# Altium schematic sheet Nguon.SchDoc
size 381 x 241 mm; SheetNumber: 1; SheetTotal: 3
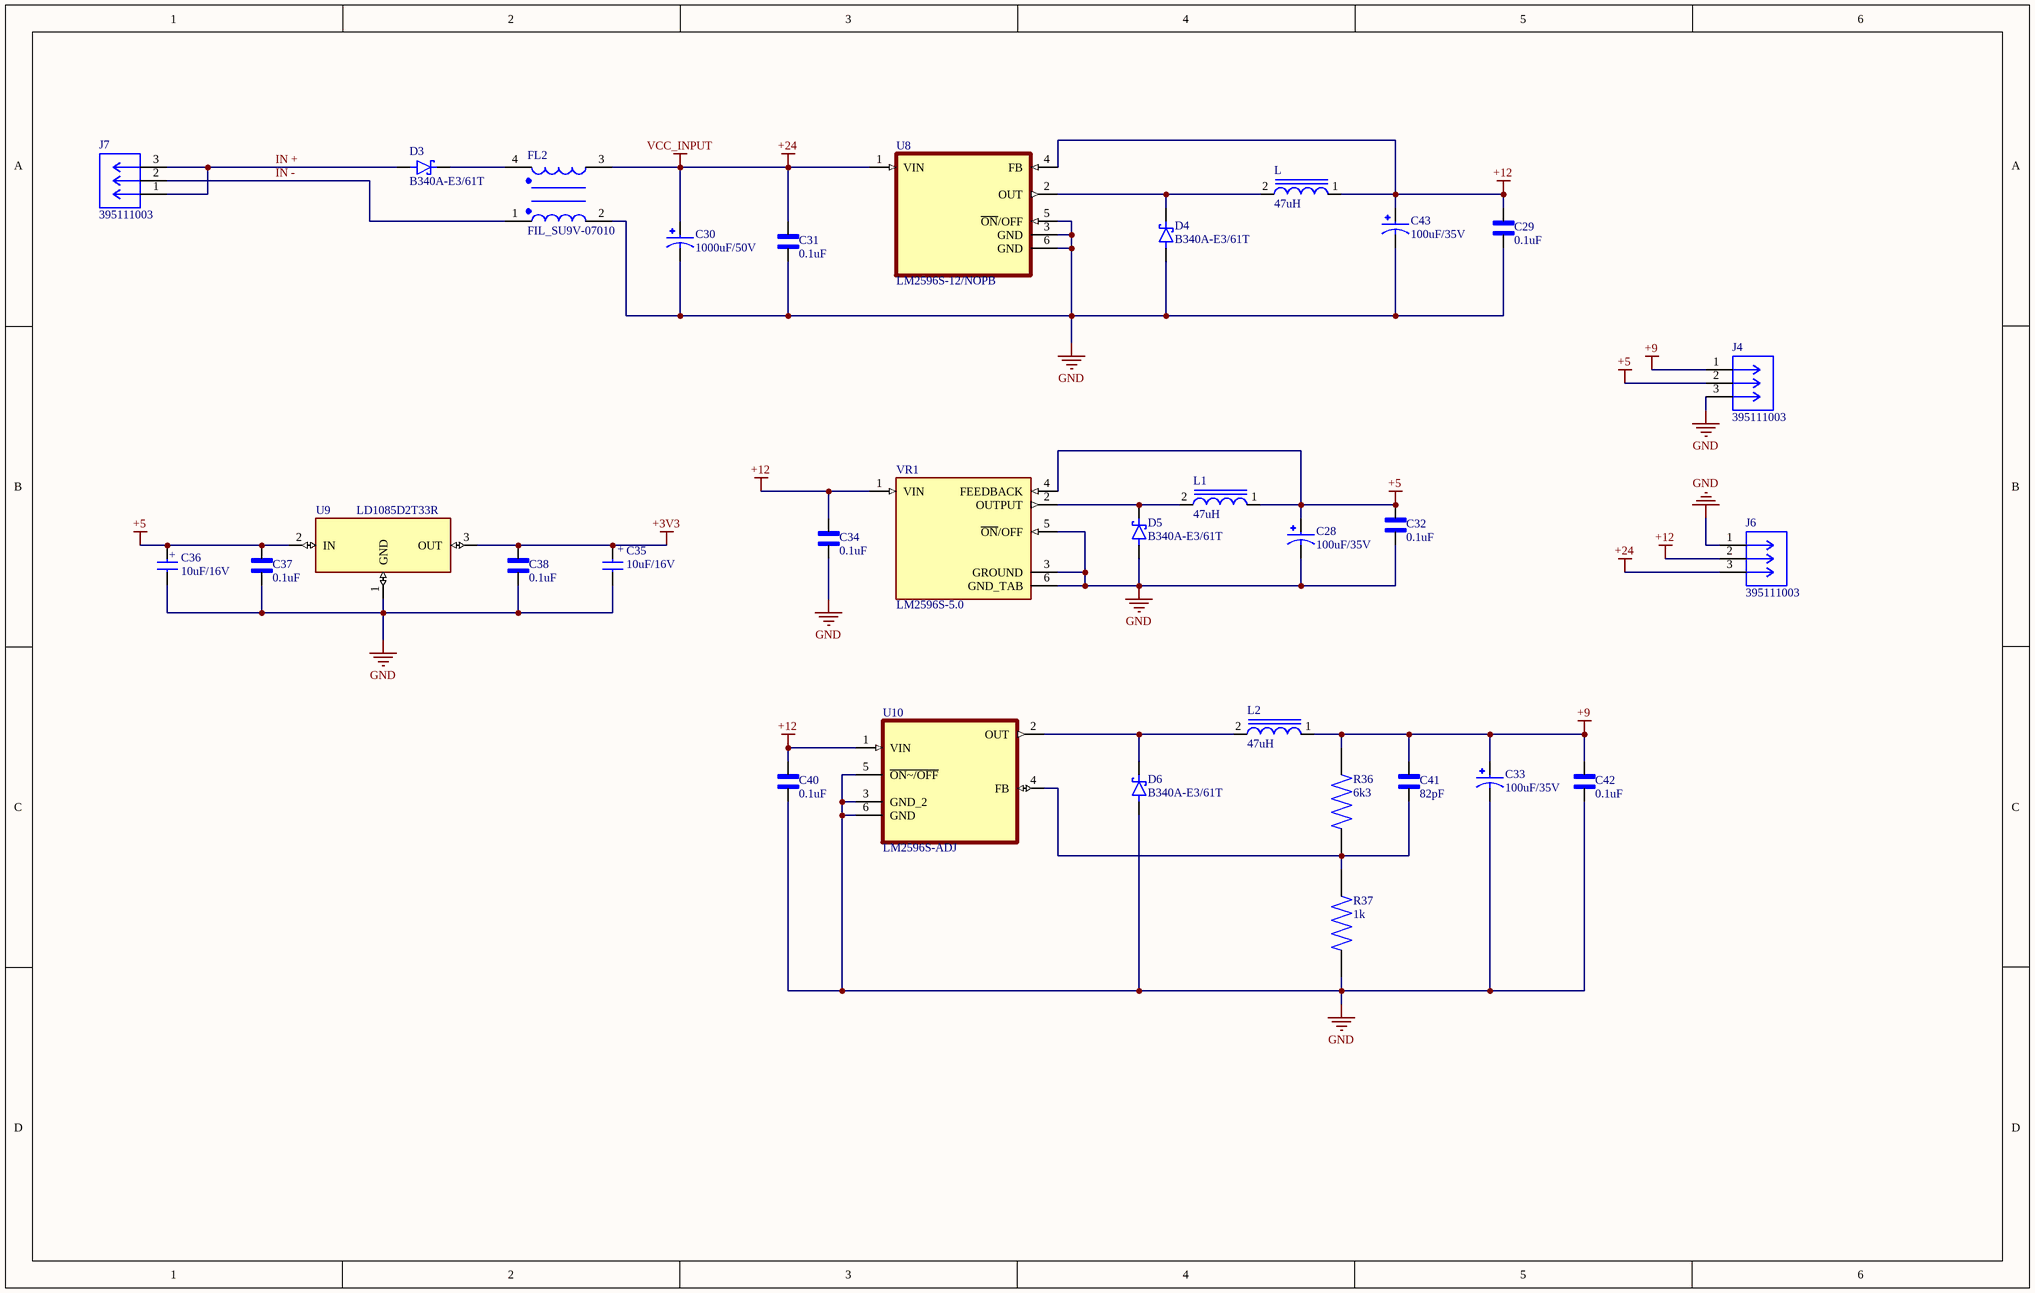
[diagram p0: Nguon.SchDoc]

## Parts
C28  100uF/35V  [CAP_EEEFTE221XAL]
C29  0.1uF  [CAPC1608X94N]
C30  1000uF/50V  [CAP_EEVFK1H102M]
C31  0.1uF  [CAPC1608X94N]
C32  0.1uF  [CAPC1608X94N]
C33  100uF/35V  [CAP_EEEFTE221XAL]
C34  0.1uF  [CAPC1608X94N]
C35  10uF/16V  [WCAP-ASNP_4X5.5(DXL)]
C36  10uF/16V  [WCAP-AS5H_4X5.5(DXL)]
C37  0.1uF  [CAPC1608X94N]
C38  0.1uF  [CAPC1608X94N]
C40  0.1uF  [CAPC1608X94N]
C41  82pF  [CAPC1608X94N]
C42  0.1uF  [CAPC1608X94N]
C43  100uF/35V  [CAP_EEEFTE221XAL]
D3  B340A-E3/61T  [DIOM5126X229N]
D4  B340A-E3/61T  [DIOM5126X229N]
D5  B340A-E3/61T  [DIOM5126X229N]
D6  B340A-E3/61T  [DIOM5126X229N]
FL2  FIL_SU9V-07010  [FIL_SU9V-07010]
J4  395111003  [CONN_SD-39511-001_03P_MOL]
J6  395111003  [CONN_SD-39511-001_03P_MOL]
J7  395111003  [CONN_SD-39511-001_03P_MOL]
L  47uH  [Introdutor_47uH_12x12x7]
L1  47uH  [Introdutor_47uH_12x12x7]
L2  47uH  [Introdutor_47uH_12x12x7]
R36  6k3  [RES_ERJU03J474V]
R37  1k  [RES_ERJU03J474V]
U8  LM2596S-12/NOPB  [VREG_LM2596S-12/NOPB]
U9  LD1085D2T33R  [LD1085D2T33R]
U10  LM2596S-ADJ  [LM2596S-ADJ]
VR1  LM2596S-5.0  [LM2596S-5.0]

## Nets
+3V3: C35.1 C38.2 U9.3(OUT)
+5: C28.1 C32.2 C36.1(POS) C37.2 J4.2 L1.1 U9.2(IN) VR1.4(FEEDBACK)
+9: C33.1 C41.2 C42.2 J4.1 L2.1 R36.2
+12: C29.2 C34.2 C40.2 C43.1 J6.2 L.1 U8.4(FB) U10.1(VIN) VR1.1(VIN)
+24: C30.1 C31.2 FL2.3 J6.3 U8.1(VIN)  [also labelled VCC_INPUT]
GND: C28.2 C29.1 C30.2 C31.1 C32.1 C33.2 C34.1 C35.2 C36.2(NEG) C37.1 C38.1 C40.1 C42.1 C43.2 D4.A D5.A D6.A FL2.2 J4.3 J6.1 R37.1 U8.3(GND) U8.5(~{ON}/OFF) U8.6(GND) U9.1(GND) U10.3(GND_2) U10.5(~{ON~/OFF}) U10.6(GND) VR1.3(GROUND) VR1.5(~{ON}/OFF) VR1.6(GND_TAB)
IN +: D3.A J7.1 J7.3
IN -: FL2.1 J7.2
NetC41_1: C41.1 R36.1 R37.2 U10.4(FB)
NetD3_C: D3.C FL2.4
NetD4_C: D4.C L.2 U8.2(OUT)
NetD5_C: D5.C L1.2 VR1.2(OUTPUT)
NetD6_C: D6.C L2.2 U10.2(OUT)

## Notes on the sheet
- (in symbol CAP_10uF_25V_WCAP-AS5H_4X5.5) +
- (in symbol WCAP-ASNP_4X5.5) +

## Library data of the parts
C28 C33 C43 = cap_220uF_25V_EEEFTE221XAL: CAP ALUM 220UF 20% 25V SMD; MF: Panasonic; SnapEDA_Link: https://www.snapeda.com/parts/EEEFTE221XAL/Panasonic/view-part/?ref=snap; Package: RADIAL-2 Panasonic; Value: *; MP: EEEFTE221XAL; Check_prices: https://www.snapeda.com/parts/EEEFTE221XAL/Panasonic/view-part/?ref=eda
C29 C31 C32 C34 C37 C38 C40-C42 = cap_0603_VJ0603D3R9DXCAP: cap 0603 (1608 Metric); MF: Vishay Vitramon; SnapEDA_Link: https://www.snapeda.com/parts/VJ0603D3R9DXCAP/Vishay/view-part/?ref=snap; Package: 1608 Vishay Vitramon; Value: *; MP: VJ0603D3R9DXCAP; Check_prices: https://www.snapeda.com/parts/VJ0603D3R9DXCAP/Vishay/view-part/?ref=eda
C30 = CAP_1000uF_50V_EEVFK1H102M: 1000ÂµF 50V Aluminum Electrolytic Capacitors Radial, Can - SMD 5000 Hrs @ 105Â°C; MF: Panasonic; SnapEDA_Link: https://www.snapeda.com/parts/EEVFK1H102M/Panasonic/view-part/5787261/?ref=snap; Check_prices: https://www.snapeda.com/parts/EEVFK1H102M/Panasonic/view-part/5787261/?ref=eda; Digi-Key_Part_Number: PCE3477CT-ND; Package: RADIAL-2 Panasonic; Value: *; MP: EEVFK1H102M
C35 = WCAP-ASNP_4X5.5: CAP ALUM 10UF 20% 16V SMD; MF: WÃ¼rth Elektronik; MP: 865250340003; SnapEDA_Link: https://www.snapeda.com/parts/865250340003/W%25C3%25BCrth+Elektronik+Midcom/view-part/?ref=snap; Package: Radial WÃ¼rth Elektronik; Value: *; Check_prices: https://www.snapeda.com/parts/865250340003/W%25C3%25BCrth+Elektronik+Midcom/view-part/?ref=eda
C36 = CAP_10uF_25V_WCAP-AS5H_4X5.5: CAP ALUM 10UF 20% 25V SMD; MF: WÃ¼rth Elektronik; MP: 865230440002; SnapEDA_Link: https://www.snapeda.com/parts/865230440002/W%25C3%25BCrth+Elektronik+Midcom/view-part/?ref=snap; Package: Radial WÃ¼rth Elektronik; Value: *; Check_prices: https://www.snapeda.com/parts/865230440002/W%25C3%25BCrth+Elektronik+Midcom/view-part/?ref=eda
D3-D6 = B340A-E3/61T: Diode Schottky 40 V 3A Surface Mount DO-214AC (SMA); MF: Vishay Semiconductor; SnapEDA_Link: https://www.snapeda.com/parts/B340A-E3/61T/Vishay/view-part/?ref=snap; Package: DO-214 Vishay Semiconductor; Value: *; MP: B340A-E3/61T; Check_prices: https://www.snapeda.com/parts/B340A-E3/61T/Vishay/view-part/?ref=eda
FL2 = FIL_SU9V-07010: 1 mH @ 1 kHz 2 Line Common Mode Choke Through Hole 700mA DCR 600mOhm; MF: Kemet; SnapEDA_Link: https://www.snapeda.com/parts/SU9V-07010/Kemet/view-part/?ref=snap; Package: Vertical-4 Kemet; Value: *; MP: SU9V-07010; Check_prices: https://www.snapeda.com/parts/SU9V-07010/Kemet/view-part/?ref=eda
J4 J6 J7 = 395111003: 3 Position Terminal Block Header, Male Pins, Shrouded (4 Side) 0.150 (3.81mm) Vertical Through Hole; MF: Molex; SnapEDA_Link: https://www.snapeda.com/parts/395111003/Molex/view-part/?ref=snap; Package: None; Value: *; MP: 395111003; Check_prices: https://www.snapeda.com/parts/395111003/Molex/view-part/?ref=eda
L L1 L2 = Introdutor_47uH_12x12x7SRR1260-470M: 47ÂµH Shielded Wirewound Inductor 2.6A 86mOhm Max Nonstandard; MF: Bourns; Value: *; Package: Nonstandard Bourns; Price: None; SnapEDA_Link: https://www.snapeda.com/parts/SRR1260-470M/Bourns/view-part/283129/?ref=snap; Availability: Unavailable; MP: SRR1260-470M
R36 R37 = res_0603_ERJU03J474V: 0603 Anti-Sulfurated; MF: Panasonic; SnapEDA_Link: https://www.snapeda.com/parts/ERJU03J474V/Panasonic/view-part/?ref=snap; Package: 1608-2 Panasonic; Value: *; MP: ERJU03J474V; Check_prices: https://www.snapeda.com/parts/ERJU03J474V/Panasonic/view-part/?ref=eda
U8 = LM2596S-12/NOPB: SIMPLE SWITCHERÂ® 4.5V to 40V, 3A Low Component Count Step-Down Regulator; MF: Texas Instruments; SnapEDA_Link: https://www.snapeda.com/parts/LM2596S-12/NOPB/Texas+Instruments/view-part/?ref=snap; Package: TO-263-5 Texas Instruments; Value: *; MP: LM2596S-12/NOPB; Check_prices: https://www.snapeda.com/parts/LM2596S-12/NOPB/Texas+Instruments/view-part/?ref=eda
U9 = LD1085D2T33R: Linear Voltage Regulator IC Positive Fixed 1 Output 3A D2PAK; MF: STMicroelectronics; SnapEDA_Link: https://www.snapeda.com/parts/LD1085D2T33R/STMicroelectronics/view-part/?ref=snap; Package: TO-263-3 STMicroelectronics; Value: *; MP: LD1085D2T33R; Check_prices: https://www.snapeda.com/parts/LD1085D2T33R/STMicroelectronics/view-part/?ref=eda
U10 = LM2596S-ADJ: Buck Switching Regulator IC Positive Adjustable 1.2V 1 Output 3A TO-263-6, DÂ²Pak (5 Leads + Tab), TO-263BA; MF: UMW; SnapEDA_Link: https://www.snapeda.com/parts/LM2596S-ADJ/Umwelt+Sensor+Teknik/view-part/?ref=snap; Package: None; Value: *; MP: LM2596S-ADJ; Check_prices: https://www.snapeda.com/parts/LM2596S-ADJ/Umwelt+Sensor+Teknik/view-part/?ref=eda
VR1 = LM2596S-5.0: SIMPLE SWITCHERÂ® 4.5V to 40V, 3A Low Component Count Step-Down Regulator; MF: Texas Instruments; MP: LM2596S-5.0/NOPB; SnapEDA_Link: https://www.snapeda.com/parts/LM2596S-5.0/NOPB/Texas+Instruments/view-part/?ref=snap; Package: TO-263-5 Texas Instruments; Value: *; Check_prices: https://www.snapeda.com/parts/LM2596S-5.0/NOPB/Texas+Instruments/view-part/?ref=eda